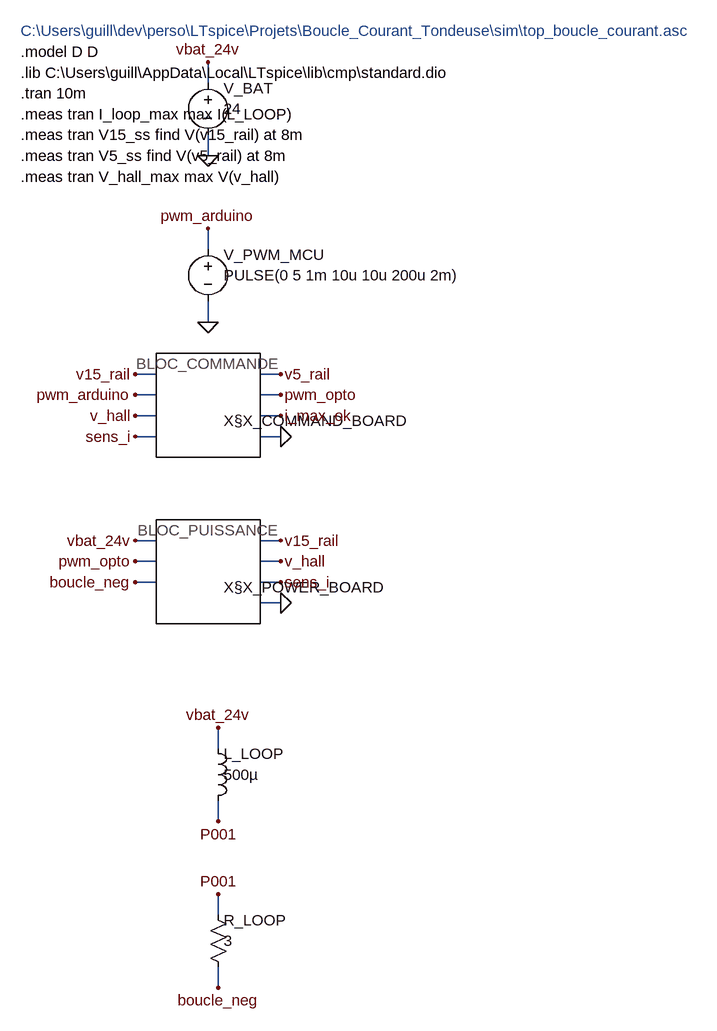
[diagram p0: schematic top_boucle_courant.asc]
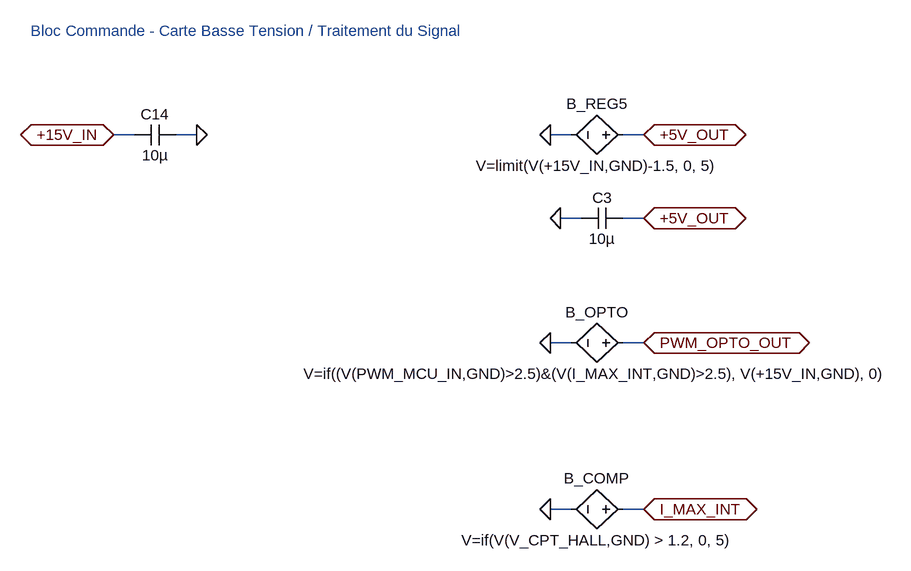
[diagram p1: sub-circuit bloc_commande.asc]
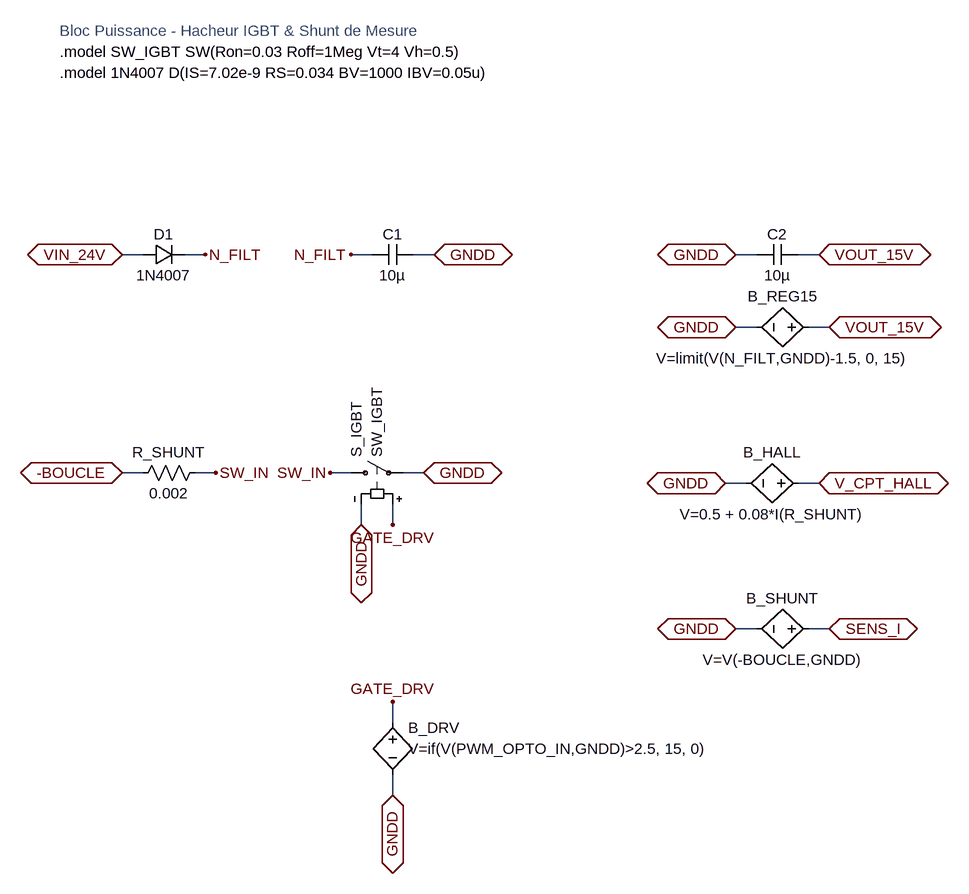
[diagram p2: sub-circuit bloc_puissance.asc]
top_boucle_courant.asc, the LTspice schematic file:
Version 4
SHEET 1 3200 2400
TEXT 32 32 Left 2 ;C:\Users\guill\dev\perso\LTspice\Projets\Boucle_Courant_Tondeuse\sim\top_boucle_courant.asc
TEXT 32 64 Left 2 !.model D D
TEXT 32 96 Left 2 !.lib C:\Users\guill\AppData\Local\LTspice\lib\cmp\standard.dio
TEXT 32 128 Left 2 !.tran 10m
TEXT 32 160 Left 2 !.meas tran I_loop_max max I(L_LOOP)
TEXT 32 192 Left 2 !.meas tran V15_ss find V(v15_rail) at 8m
TEXT 32 224 Left 2 !.meas tran V5_ss find V(v5_rail) at 8m
TEXT 32 256 Left 2 !.meas tran V_hall_max max V(v_hall)
SYMBOL voltage 320 96 R0
WINDOW 0 24 24 Left 2
WINDOW 3 24 56 Left 2
SYMATTR InstName V_BAT
SYMATTR Value 24
WIRE 320 112 320 80
FLAG 320 80 vbat_24v
WIRE 320 192 320 224
FLAG 320 224 0
SYMBOL voltage 320 352 R0
WINDOW 0 24 24 Left 2
WINDOW 3 24 56 Left 2
SYMATTR InstName V_PWM_MCU
SYMATTR Value PULSE(0 5 1m 10u 10u 200u 2m)
WIRE 320 368 320 336
FLAG 320 336 pwm_arduino
WIRE 320 448 320 480
FLAG 320 480 0
SYMBOL bloc_commande 320 608 R0
WINDOW 0 24 24 Left 2
WINDOW 3 24 56 Left 2
SYMATTR InstName X§X_COMMAND_BOARD
WIRE 240 560 208 560
FLAG 208 560 v15_rail
WIRE 240 592 208 592
FLAG 208 592 pwm_arduino
WIRE 240 624 208 624
FLAG 208 624 v_hall
WIRE 240 656 208 656
FLAG 208 656 sens_i
WIRE 400 560 432 560
FLAG 432 560 v5_rail
WIRE 400 592 432 592
FLAG 432 592 pwm_opto
WIRE 400 624 432 624
FLAG 432 624 i_max_ok
WIRE 400 656 432 656
FLAG 432 656 0
SYMBOL bloc_puissance 320 864 R0
WINDOW 0 24 24 Left 2
WINDOW 3 24 56 Left 2
SYMATTR InstName X§X_POWER_BOARD
WIRE 240 816 208 816
FLAG 208 816 vbat_24v
WIRE 240 848 208 848
FLAG 208 848 pwm_opto
WIRE 240 880 208 880
FLAG 208 880 boucle_neg
WIRE 400 816 432 816
FLAG 432 816 v15_rail
WIRE 400 848 432 848
FLAG 432 848 v_hall
WIRE 400 880 432 880
FLAG 432 880 sens_i
WIRE 400 912 432 912
FLAG 432 912 0
SYMBOL ind 320 1120 R0
WINDOW 0 24 24 Left 2
WINDOW 3 24 56 Left 2
SYMATTR InstName L_LOOP
SYMATTR Value 500µ
WIRE 336 1136 336 1104
FLAG 336 1104 vbat_24v
WIRE 336 1216 336 1248
FLAG 336 1248 P001
SYMBOL res 320 1376 R0
WINDOW 0 24 24 Left 2
WINDOW 3 24 56 Left 2
SYMATTR InstName R_LOOP
SYMATTR Value 3
WIRE 336 1392 336 1360
FLAG 336 1360 P001
WIRE 336 1472 336 1504
FLAG 336 1504 boucle_neg

bloc_commande.asc, the sub-circuit schematic file:
Version 4.1
SHEET 1 3200 2400
WIRE -16 -32 -48 -32
WIRE 80 -32 48 -32
WIRE 656 -32 624 -32
WIRE 768 -32 736 -32
WIRE 672 96 640 96
WIRE 768 96 736 96
WIRE 656 288 624 288
WIRE 768 288 736 288
WIRE 656 544 624 544
WIRE 768 544 736 544
FLAG -48 -32 +15V_IN
IOPIN -48 -32 BiDir
FLAG 80 -32 0
IOPIN 80 -32 BiDir
FLAG 768 -32 +5V_OUT
IOPIN 768 -32 BiDir
FLAG 624 -32 0
IOPIN 624 -32 BiDir
FLAG 768 96 +5V_OUT
IOPIN 768 96 BiDir
FLAG 640 96 0
IOPIN 640 96 BiDir
FLAG 768 288 PWM_OPTO_OUT
IOPIN 768 288 BiDir
FLAG 624 288 0
IOPIN 624 288 BiDir
FLAG 768 544 I_MAX_INT
IOPIN 768 544 BiDir
FLAG 624 544 0
IOPIN 624 544 BiDir
SYMBOL cap -16 -16 R270
WINDOW 0 32 32 VTop 2
WINDOW 3 0 32 VBottom 2
SYMATTR InstName C14
SYMATTR Value 10µ
SYMBOL bv 752 -32 R90
WINDOW 0 -32 56 VBottom 2
WINDOW 3 32 56 VTop 2
SYMATTR InstName B_REG5
SYMATTR Value V=limit(V(+15V_IN,GND)-1.5, 0, 5)
SYMBOL cap 736 80 R90
WINDOW 0 0 32 VBottom 2
WINDOW 3 32 32 VTop 2
SYMATTR InstName C3
SYMATTR Value 10µ
SYMBOL bv 752 288 R90
WINDOW 0 -32 56 VBottom 2
WINDOW 3 32 56 VTop 2
SYMATTR InstName B_OPTO
SYMATTR Value V=if((V(PWM_MCU_IN,GND)>2.5)&(V(I_MAX_INT,GND)>2.5), V(+15V_IN,GND), 0)
SYMBOL bv 752 544 R90
WINDOW 0 -32 56 VBottom 2
WINDOW 3 32 56 VTop 2
SYMATTR InstName B_COMP
SYMATTR Value V=if(V(V_CPT_HALL,GND) > 1.2, 0, 5)
TEXT -176 -192 Left 2 ;Bloc Commande - Carte Basse Tension / Traitement du Signal

bloc_puissance.asc, the sub-circuit schematic file:
Version 4.1
SHEET 1 3200 2400
WIRE -864 336 -896 336
WIRE -768 336 -800 336
WIRE -512 336 -544 336
WIRE -416 336 -448 336
WIRE 80 336 48 336
WIRE 176 336 144 336
WIRE 80 448 48 448
WIRE 192 448 160 448
WIRE -864 672 -896 672
WIRE -752 672 -784 672
WIRE -544 672 -576 672
WIRE -432 672 -464 672
WIRE 64 688 32 688
WIRE 176 688 144 688
WIRE -528 752 -528 720
WIRE -480 752 -480 720
WIRE 80 912 48 912
WIRE 192 912 160 912
WIRE -480 1056 -480 1024
WIRE -480 1168 -480 1136
FLAG -896 336 VIN_24V
IOPIN -896 336 BiDir
FLAG -768 336 N_FILT
FLAG -544 336 N_FILT
FLAG -416 336 GNDD
IOPIN -416 336 BiDir
FLAG 192 448 VOUT_15V
IOPIN 192 448 BiDir
FLAG 48 448 GNDD
IOPIN 48 448 BiDir
FLAG 176 336 VOUT_15V
IOPIN 176 336 BiDir
FLAG 48 336 GNDD
IOPIN 48 336 BiDir
FLAG -480 1024 GATE_DRV
FLAG -480 1168 GNDD
IOPIN -480 1168 BiDir
FLAG -896 672 -BOUCLE
IOPIN -896 672 BiDir
FLAG -752 672 SW_IN
FLAG -576 672 SW_IN
FLAG -432 672 GNDD
IOPIN -432 672 BiDir
FLAG -480 752 GATE_DRV
FLAG -528 752 GNDD
IOPIN -528 752 BiDir
FLAG 176 688 V_CPT_HALL
IOPIN 176 688 BiDir
FLAG 32 688 GNDD
IOPIN 32 688 BiDir
FLAG 192 912 SENS_I
IOPIN 192 912 BiDir
FLAG 48 912 GNDD
IOPIN 48 912 BiDir
SYMBOL diode -864 352 R270
WINDOW 0 32 32 VTop 2
WINDOW 3 0 32 VBottom 2
SYMATTR InstName D1
SYMATTR Value 1N4007
SYMBOL cap -512 352 R270
WINDOW 0 32 32 VTop 2
WINDOW 3 0 32 VBottom 2
SYMATTR InstName C1
SYMATTR Value 10µ
SYMBOL bv 176 448 R90
WINDOW 0 -32 56 VBottom 2
WINDOW 3 32 56 VTop 2
SYMATTR InstName B_REG15
SYMATTR Value V=limit(V(N_FILT,GNDD)-1.5, 0, 15)
SYMBOL cap 144 320 R90
WINDOW 0 0 32 VBottom 2
WINDOW 3 32 32 VTop 2
SYMATTR InstName C2
SYMATTR Value 10µ
SYMBOL bv -480 1040 R0
WINDOW 0 24 24 Left 2
WINDOW 3 24 56 Left 2
SYMATTR InstName B_DRV
SYMATTR Value V=if(V(PWM_OPTO_IN,GNDD)>2.5, 15, 0)
SYMBOL res -880 688 R270
WINDOW 0 32 56 VTop 2
WINDOW 3 0 56 VBottom 2
SYMATTR InstName R_SHUNT
SYMATTR Value 0.002
SYMBOL sw -560 672 R270
WINDOW 0 24 24 Left 2
WINDOW 3 24 56 Left 2
SYMATTR InstName S_IGBT
SYMATTR Value SW_IGBT
SYMBOL bv 160 688 R90
WINDOW 0 -32 56 VBottom 2
WINDOW 3 32 56 VTop 2
SYMATTR InstName B_HALL
SYMATTR Value V=0.5 + 0.08*I(R_SHUNT)
SYMBOL bv 176 912 R90
WINDOW 0 -32 56 VBottom 2
WINDOW 3 32 56 VTop 2
SYMATTR InstName B_SHUNT
SYMATTR Value V=V(-BOUCLE,GNDD)
TEXT -992 -8 Left 2 ;Bloc Puissance - Hacheur IGBT & Shunt de Mesure
TEXT -992 24 Left 2 !.model SW_IGBT SW(Ron=0.03 Roff=1Meg Vt=4 Vh=0.5)
TEXT -992 56 Left 2 !.model 1N4007 D(IS=7.02e-9 RS=0.034 BV=1000 IBV=0.05u)

The netlist it stands for:
* top_boucle_courant.asc
V_BAT vbat_24v 0 24
V_PWM_MCU pwm_arduino 0 PULSE(0 5 1m 10u 10u 200u 2m)
XX§X_COMMAND_BOARD v15_rail pwm_arduino v_hall sens_i v5_rail pwm_opto i_max_ok 0 bloc_commande
XX§X_POWER_BOARD vbat_24v pwm_opto boucle_neg v15_rail v_hall sens_i 0 bloc_puissance
L_LOOP vbat_24v P001 500µ
R_LOOP P001 boucle_neg 3

* block symbol definitions
.subckt bloc_commande +15V_IN PWM_MCU_IN V_CPT_HALL SENS_I +5V_OUT PWM_OPTO_OUT I_MAX_INT GND
C14 +15V_IN 0 10µ
B_REG5 +5V_OUT 0 V=limit(V(+15V_IN,GND)-1.5, 0, 5)
C3 +5V_OUT 0 10µ
B_OPTO PWM_OPTO_OUT 0 V=if((V(PWM_MCU_IN,GND)>2.5)&(V(I_MAX_INT,GND)>2.5), V(+15V_IN,GND), 0)
B_COMP I_MAX_INT 0 V=if(V(V_CPT_HALL,GND) > 1.2, 0, 5)
* Bloc Commande - Carte Basse Tension / Traitement du Signal
.ends bloc_commande

.subckt bloc_puissance VIN_24V PWM_OPTO_IN -BOUCLE VOUT_15V V_CPT_HALL SENS_I GNDD
D1 VIN_24V N_FILT 1N4007
C1 N_FILT GNDD 10µ
B_REG15 VOUT_15V GNDD V=limit(V(N_FILT,GNDD)-1.5, 0, 15)
C2 VOUT_15V GNDD 10µ
B_DRV GATE_DRV GNDD V=if(V(PWM_OPTO_IN,GNDD)>2.5, 15, 0)
R_SHUNT -BOUCLE SW_IN 0.002
S_IGBT SW_IN GNDD GATE_DRV GNDD SW_IGBT
B_HALL V_CPT_HALL GNDD V=0.5 + 0.08*I(R_SHUNT)
B_SHUNT SENS_I GNDD V=V(-BOUCLE,GNDD)
* Bloc Puissance - Hacheur IGBT & Shunt de Mesure
.model SW_IGBT SW(Ron=0.03 Roff=1Meg Vt=4 Vh=0.5)
.model 1N4007 D(IS=7.02e-9 RS=0.034 BV=1000 IBV=0.05u)
.ends bloc_puissance

.model D D
.lib standard.dio
* C:\Users\guill\dev\perso\LTspice\Projets\Boucle_Courant_Tondeuse\sim\top_boucle_courant.asc
.model D D
.lib C:\Users\guill\AppData\Local\LTspice\lib\cmp\standard.dio
.tran 10m
.meas tran I_loop_max max I(L_LOOP)
.meas tran V15_ss find V(v15_rail) at 8m
.meas tran V5_ss find V(v5_rail) at 8m
.meas tran V_hall_max max V(v_hall)
.backanno
.end